# Altium schematic sheet Controles.SchDoc
size A; SheetNumber: 6; SheetTotal: 6
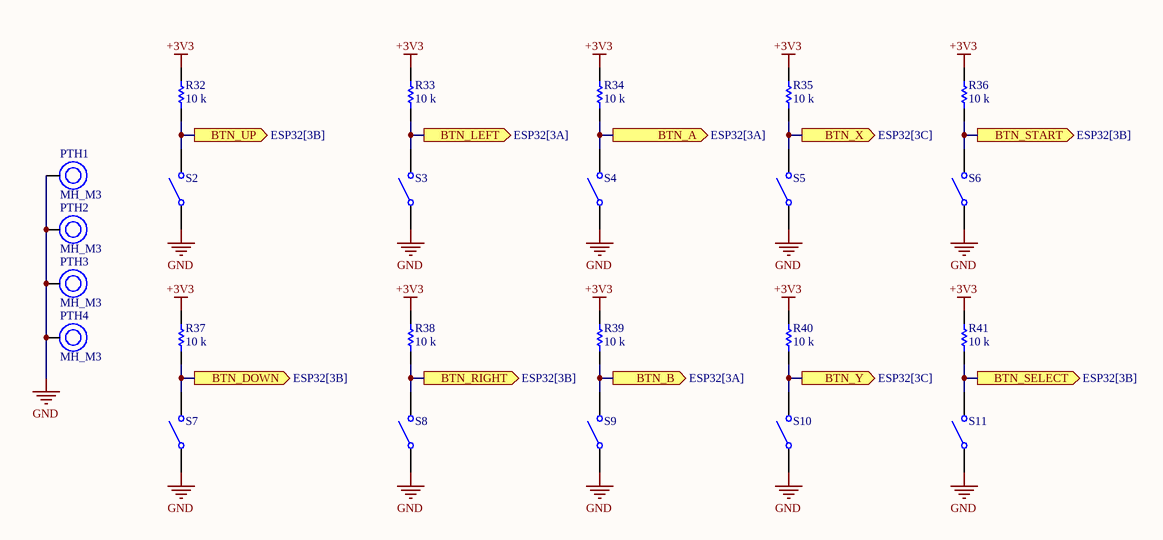
[diagram p0: Controles.SchDoc]

## Parts
PTH1  MH_M3  [PCBComponent_1]
PTH2  MH_M3  [PCBComponent_1]
PTH3  MH_M3  [PCBComponent_1]
PTH4  MH_M3  [PCBComponent_1]
R32  value 10 k  [RES 0805_2012]  (hidden comment: Resistor)
R33  value 10 k  [RES 0805_2012]  (hidden comment: Resistor)
R34  value 10 k  [RES 0805_2012]  (hidden comment: Resistor)
R35  value 10 k  [RES 0805_2012]  (hidden comment: Resistor)
R36  value 10 k  [RES 0805_2012]  (hidden comment: Resistor)
R37  value 10 k  [RES 0805_2012]  (hidden comment: Resistor)
R38  value 10 k  [RES 0805_2012]  (hidden comment: Resistor)
R39  value 10 k  [RES 0805_2012]  (hidden comment: Resistor)
R40  value 10 k  [RES 0805_2012]  (hidden comment: Resistor)
R41  value 10 k  [RES 0805_2012]  (hidden comment: Resistor)
S2  Single-Pole, Single-Throw Switch  [SNES_BTN_soft+mech_5mm_0.3_0.3]  (value not drawn)
S3  Single-Pole, Single-Throw Switch  [SNES_BTN_soft+mech_5mm_0.3_0.3]  (value not drawn)
S4  Single-Pole, Single-Throw Switch  [SNES_BTN_soft+mech_5mm_0.3_0.3]  (value not drawn)
S5  Single-Pole, Single-Throw Switch  [SNES_BTN_soft+mech_5mm_0.3_0.3]  (value not drawn)
S6  Single-Pole, Single-Throw Switch  [SNES_BTN_soft+mech_5mm_0.3_0.3]  (value not drawn)
S7  Single-Pole, Single-Throw Switch  [SNES_BTN_soft+mech_5mm_0.3_0.3]  (value not drawn)
S8  Single-Pole, Single-Throw Switch  [SNES_BTN_soft+mech_5mm_0.3_0.3]  (value not drawn)
S9  Single-Pole, Single-Throw Switch  [SNES_BTN_soft+mech_5mm_0.3_0.3]  (value not drawn)
S10  Single-Pole, Single-Throw Switch  [SNES_BTN_soft+mech_5mm_0.3_0.3]  (value not drawn)
S11  Single-Pole, Single-Throw Switch  [SNES_BTN_soft+mech_5mm_0.3_0.3]  (value not drawn)

## Ports
BTN_A (out, see ESP32[3A]), BTN_B (out, see ESP32[3A]), BTN_DOWN (out, see ESP32[3B]), BTN_LEFT (out, see ESP32[3A]), BTN_RIGHT (out, see ESP32[3B]), BTN_SELECT (out, see ESP32[3B]), BTN_START (out, see ESP32[3B]), BTN_UP (out, see ESP32[3B]), BTN_X (out, see ESP32[3C]), BTN_Y (out, see ESP32[3C])

## Nets
+3V3: R32.2 R33.2 R34.2 R35.2 R36.2 R37.2 R38.2 R39.2 R40.2 R41.2
GND: PTH1.1 PTH2.1 PTH3.1 PTH4.1 S2.1 S3.1 S4.1 S5.1 S6.1 S7.1 S8.1 S9.1 S10.1 S11.1
BTN_A: R34.1 S4.2 ; port BTN_A
BTN_B: R39.1 S9.2 ; port BTN_B
BTN_DOWN: R37.1 S7.2 ; port BTN_DOWN
BTN_LEFT: R33.1 S3.2 ; port BTN_LEFT
BTN_RIGHT: R38.1 S8.2 ; port BTN_RIGHT
BTN_SELECT: R41.1 S11.2 ; port BTN_SELECT
BTN_START: R36.1 S6.2 ; port BTN_START
BTN_UP: R32.1 S2.2 ; port BTN_UP
BTN_X: R35.1 S5.2 ; port BTN_X
BTN_Y: R40.1 S10.2 ; port BTN_Y

## Notes on the sheet
- Title:
- Date:
- Size:
- A3
- Number:
- Institution:
- Universidad Anáhuac Querétaro
- Drawn by:
- Marco Antonio Guereca Soto
- Check by:
- Morrison Ernesto Rodríguez Gutiérrez

## Library data of the parts
R32-R41 = Resistor: TC1: 0; SimulationGenericComponent: True; TC2: 0
S2-S11 = SPST SW: closed: 0; Rclosed: 1m; Ropen: 1Meg; SimulationGenericComponent: True